# EasyEDA Pro project ProPrj_H750VBT6M2_2025-05-30.epro, board PCB1
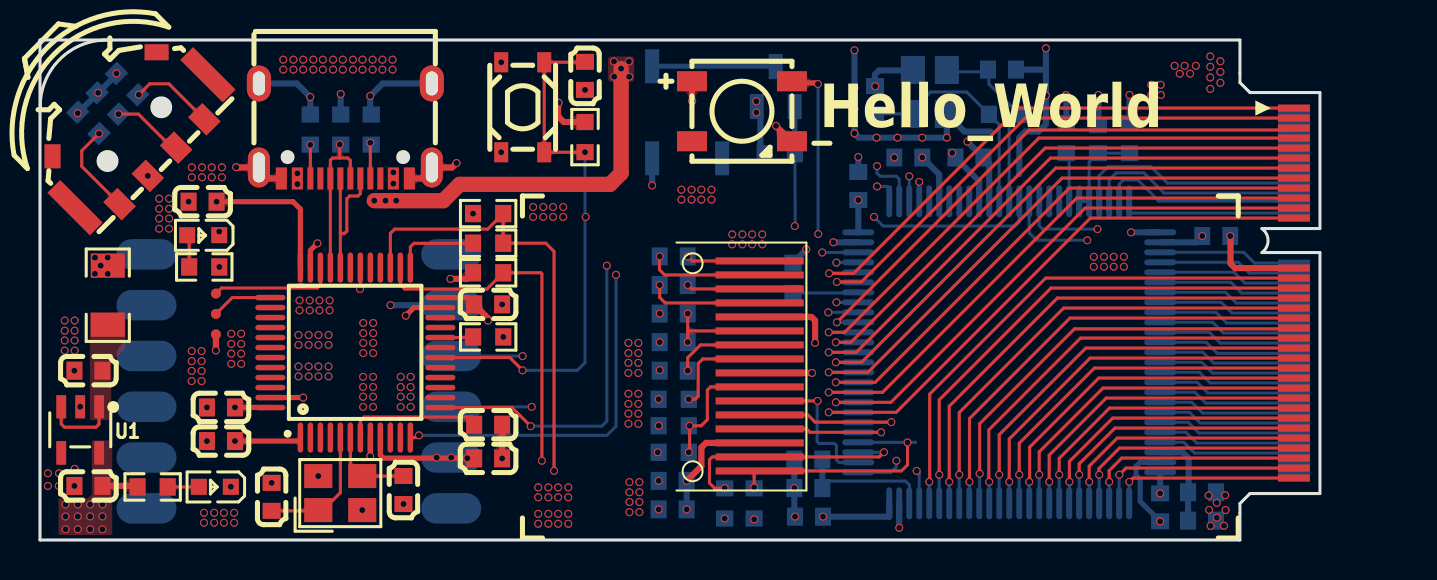
[diagram p2: board, top side]
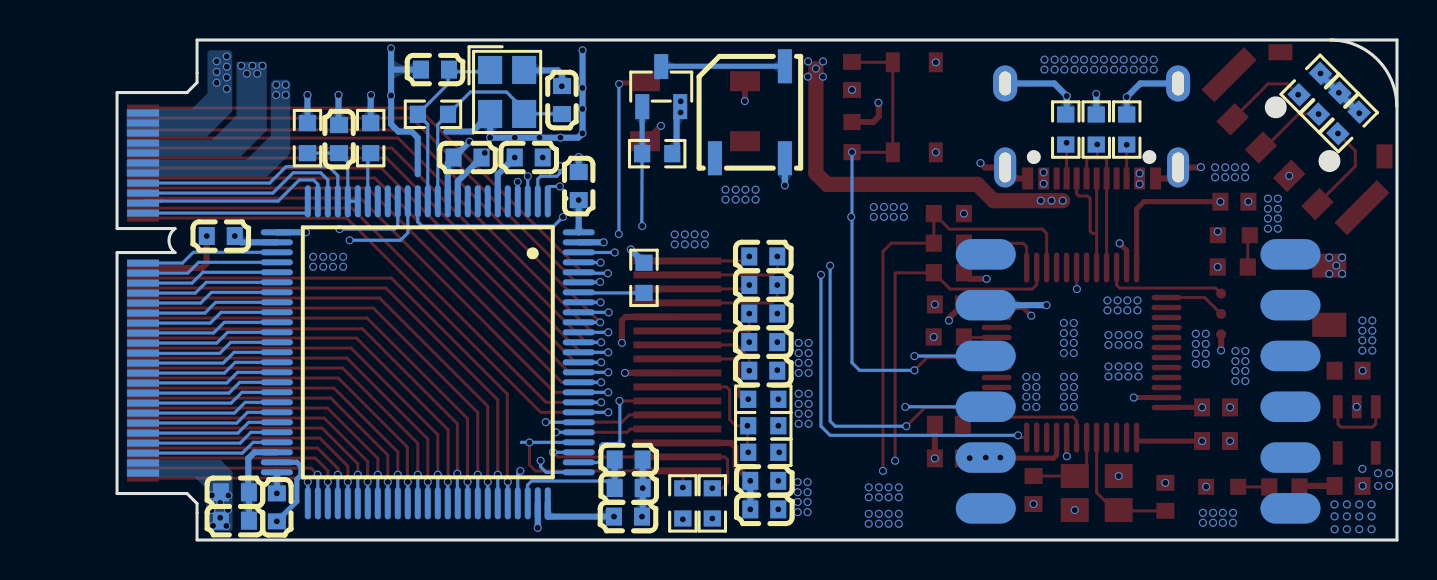
[diagram p3: board, bottom side, seen from below]

Outline 67.87 x 25 mm; copper layers: Top Layer, Inner1, Inner2, Inner3, Inner4, Bottom Layer. Coordinates in mm from the lower left corner of the outline.
Outline path: 0.01,21.68 arc(0.98,24.03) 3.33,25 ; 60.01,23.35 60.01,25 0,25 0,0 60.01,0 60.01,1.35
Stack: Top Layer 0.035mm 外层铜厚1oz / Dielectric1 0.0994mm 3313 RC57% 4.2mil / Inner1 0.0152mm 内层铜厚 / Dielectric2 0.55mm 0.55mm H/H No copper / Inner2 0.0152mm 内层铜厚 / Dielectric3 0.1088mm 2116 RC54% 4.9mil / Inner3 0.0152mm 内层铜厚 / Dielectric4 0.55mm 0.55mm H/H No copper / Inner4 0.0152mm 内层铜厚 / Dielectric5 0.0994mm 3313 RC57% 4.2mil / Bottom Layer 0.035mm 外层铜厚1oz

## Design rules (mm)
net DN: DP1
net DP: DP1
template: 自定义配置
spacing copperThickness1oz (default): track to track 0.152, other pairs 0.15 to 0.152
spacing copperThickness2oz: track to track 0.203, other pairs 0.152 to 0.3
track width copperThickness1oz (default): min 0.127, default 0.152, max 2.54
track width copperThickness2oz: min 0.203, default 0.305, max 2.54
differential pair differentialPair (default): width min 0.127, default 0.254, max 2.54; gap min 0.152, default 0.152
via viaSize (default): diameter min 0.399, default 0.399, max 10; hole min 0.3, default 0.3, max 6.299
net 3V3 uses copperThickness2oz
net GND uses copperThickness2oz
net 5V uses copperThickness2oz

## Placement (name value [footprint] x y rotation side)
BUZZER1  4kHz  [BUZ-SMD_L5.0-W5.5-P4.60]  32.37 21.39 90 bottom
C1  100nF  [C0603]  2.42 8.47 0 top
C2  100nF  [C0603]  2.42 2.7 0 top
C4  100nF  [C0603]  58.83 15.2 180 bottom
C5  100nF  [C0603]  43.43 19.12 0 bottom
C6  100nF  [C0603]  46.49 19.12 0 bottom
C7  100nF  [C0603]  38.46 1.17 0 bottom
C8  100nF  [C0603]  40.93 17.7 270 bottom
C9  100nF  [C0603]  56.02 1.63 90 bottom
C12  12pF  [C0603]  11.59 2.16 90 top
C13  12pF  [C0603]  18.18 2.5 90 top
C14  100nF  [C0603]  9.05 6.63 0 top
C15  100nF  [C0603]  9.05 4.95 0 top
C16  100nF  [C0603]  22.41 4.08 180 top
C17  100nF  [C0603]  22.41 11.78 180 top
C18  100nF  [C0603]  8.13 16.92 0 top
C19  100nF  [C0603]  22.41 5.76 180 top
C21  2.2uF  [C0603]  58.12 2.39 0 bottom
C22  2.2uF  [C0603]  58.12 0.97 0 bottom
C23  2.2uF  [C0603]  38.43 4.02 0 bottom
C24  2.2uF  [C0603]  38.43 2.59 0 bottom
C25  100nF  [C0603]  52.91 20.04 270 bottom
C26  100nF  [C0603]  27.26 23.21 90 top
C27  1uF  [C0603]  31.69 14.18 180 bottom
C28  1uF  [C0603]  31.69 12.75 180 bottom
C29  100nF  [C0603]  31.64 2.96 180 bottom
C30  4.7uF  [C0603]  31.64 1.53 180 bottom
C31  2.2uF  [C0603]  31.69 8.47 180 bottom
C32  100nF  [C0603]  31.69 9.89 180 bottom
C33  4.7uF  [C0603]  31.69 11.32 180 bottom
C34  15pF  [C0603]  41.76 22 90 bottom
C35  15pF  [C0603]  48.11 23.52 180 bottom
CN1  M.2-E Key GF  [NGFF-M.2-75P-0.5mmE KEYGF]  64.01 12.35 270 top
LED1  -  [LED_0603]  8.69 2.65 180 top
LED3  -  [LED_0603]  8.11 15.23 180 top
LED4  XL-5050RGBC-WS2812B  [LED-SMD_4P-L5.0-W5.0-BL_XL-5050RGBC]  35.11 21.44 270 top
Q1  -  [SOT-23-3_L2.9-W1.3-P1.90-LS2.4-BR]  36.8 22.67 270 bottom
R1  1K  [R0603]  5.63 2.65 0 top
R2  1.1A 6V  [R1206]  3.39 12.24 270 top
R6  5.1K  [R0603]  16.57 20.52 90 bottom
R7  5.1K  [R0603]  13.52 20.52 90 bottom
R8  100R  [R0603]  22.41 14.84 0 top
R9  10K  [R0603]  22.41 16.32 180 top
R10  10K  [R0603]  22.41 13.36 180 top
R11  1K  [R0603]  8.22 13.65 180 top
R12  10K  [R0603]  22.42 10.15 180 top
R13  0R  [R0603]  51.33 20.09 270 bottom
R14  0R  [R0603]  54.49 20.09 270 bottom
R15  10K  [R0603]  27.26 20.15 90 top
R16  10K  [R0603]  37.66 13.11 90 bottom
R59  10K  [R0603]  2.42 20.86 135 bottom
R60  10K  [R0603]  4.36 22.8 135 bottom
R61  10K  [R0603]  3.39 21.83 135 bottom
R62  4.7K  [R0603]  31.69 4.39 180 bottom
R63  4.7K  [R0603]  31.69 5.71 0 bottom
R64  390K  [R0603]  31.69 7.04 180 bottom
R65  10K  [R0603]  35.72 1.83 90 bottom
R66  10K  [R0603]  34.24 1.83 90 bottom
R67  1.5K  [R0603]  15.04 20.52 270 bottom
R68  1M  [R0603]  48.21 21.28 180 bottom
R69  10K  [R0603]  37 19.32 180 bottom
SW1  TS3425BA  [SW-SMD_4P-L4.2-W3.2-P2.15-LS4.6-1]  24.14 21.64 270 top
SW2  TM-2024A  [SW-SMD_TM-2024A]  4.66 20.35 45 top
TP1  -  [Test-Point-0.5mm]  8.8 12.32 0 top
TP2  -  [Test-Point-0.5mm]  8.8 11.3 0 top
TP3  -  [Test-Point-0.5mm]  8.8 10.28 0 top
U1  RT9013-33GB  [SOT-23-5_L3.0-W1.7-P0.95-LS2.8-BL]  2.01 5.51 180 top
U2  STM32H750VBT6  [LQFP-100_L14.0-W14.0-P0.50-LS16.0-BL]  48.47 9.38 0 bottom
U4  STM32F103C8T6  [LQFP-48_L7.0-W7.0-P0.50-LS9.0-BL]  15.77 9.37 0 top
U5  -  [JY901S]  5.33 1.58 0 bottom
U6  -  [1.29oled_spi_焊接_ch1115]  58.88 1.07 180 top
USB1  TYPE-C 16PIN 2MD(073)  [USB-C-SMD_TYPE-C-6PIN-2MD-073]  15.27 20.45 180 top
X2  8MHz  [CRYSTAL-SMD_4P-L3.2-W2.5-BL]  15.02 2.35 0 top
X3  25MHz  [CRYSTAL-SMD_4P-L3.2-W2.5-BL]  44.51 22.4 270 bottom

## Footprints (pads in the part's own frame, mm; a bottom-side part is the same pattern mirrored in y, then rotated)
1.29oled_spi_焊接_ch1115
  rect 4.4x0.35 smd: 1(22.884,-12.883) 2(22.884,-12.183) 3(22.884,-11.483) 4(22.884,-10.783) 5(22.884,-10.083) 6(22.884,-9.383) 7(22.884,-8.683) 8(22.884,-7.983) 9(22.884,-7.283) 10(22.884,-6.583) 11(22.884,-5.883) 12(22.884,-5.183) 13(22.884,-4.483) 14(22.884,-3.783) 15(22.884,-3.083) 16(22.884,-2.383)
BUZ-SMD_L5.0-W5.5-P4.60
  rect 1.7x0.7 smd: 1(-2.3,-1.75) 2(2.3,-1.75) 3(-2.3,1.75)
C0603
  rect 0.8x0.9 smd: 1(-0.7,0) 2(0.7,0)
CRYSTAL-SMD_4P-L3.2-W2.5-BL
  rect 1.4x1.2 smd: 1(-1.1,-0.85) 2(1.1,-0.85) 3(1.1,0.85) 4(-1.1,0.85)
JY901S
  oval 3x1.524 smd: 1(0,0) 2(0,-2.54) 3(0,-5.08) 4(0,-7.62) 5(0,-10.16) 6(0,-12.7) 7(15.24,-12.7) 8(15.24,-10.16) 9(15.24,-7.62) 10(15.24,-5.08) 11(15.24,-2.54) 12(15.24,0)
LED-SMD_4P-L5.0-W5.0-BL_XL-5050RGBC
  rect 1x1.5 smd: 1(-1.5,-2.5) 2(1.5,-2.5) 3(1.5,2.5) 4(-1.5,2.5)
LED_0603
  rect 0.8x0.8 smd: 1(-0.851,-0.01) 2(0.75,-0.005)
LQFP-48_L7.0-W7.0-P0.50-LS9.0-BL
  oval 0.27x1.5 smd: 1(-2.75,-4.25) 2(-2.25,-4.25) 3(-1.75,-4.25) 4(-1.25,-4.25) 5(-0.75,-4.25) 6(-0.25,-4.25) 7(0.25,-4.25) 8(0.75,-4.25) 9(1.25,-4.25) 10(1.75,-4.25) 11(2.25,-4.25) 12(2.75,-4.25) 25(2.75,4.25) 26(2.25,4.25) 27(1.75,4.25) 28(1.25,4.25) 29(0.75,4.25) 30(0.25,4.25) 31(-0.25,4.25) 32(-0.75,4.25) 33(-1.25,4.25) 34(-1.75,4.25) 35(-2.25,4.25) 36(-2.75,4.25)
  oval 1.5x0.27 smd: 13(4.25,-2.75) 14(4.25,-2.25) 15(4.25,-1.75) 16(4.25,-1.25) 17(4.25,-0.75) 18(4.25,-0.25) 19(4.25,0.25) 20(4.25,0.75) 21(4.25,1.25) 22(4.25,1.75) 23(4.25,2.25) 24(4.25,2.75) 37(-4.25,2.75) 38(-4.25,2.25) 39(-4.25,1.75) 40(-4.25,1.25) 41(-4.25,0.75) 42(-4.25,0.25) 43(-4.25,-0.25) 44(-4.25,-0.75) 45(-4.25,-1.25) 46(-4.25,-1.75) 47(-4.25,-2.25) 48(-4.25,-2.75)
LQFP-100_L14.0-W14.0-P0.50-LS16.0-BL
  oval 0.3x1.6 smd: 1(-6,-7.55) 2(-5.5,-7.55) 3(-5,-7.55) 4(-4.5,-7.55) 5(-4,-7.55) 6(-3.5,-7.55) 7(-3,-7.55) 8(-2.5,-7.55) 9(-2,-7.55) 10(-1.5,-7.55) 11(-1,-7.55) 12(-0.5,-7.55) 13(0,-7.55) 14(0.5,-7.55) 15(1,-7.55) 16(1.5,-7.55) 17(2,-7.55) 18(2.5,-7.55) 19(3,-7.55) 20(3.5,-7.55) 21(4,-7.55) 22(4.5,-7.55) 23(5,-7.55) 24(5.5,-7.55) 25(6,-7.55) 51(6,7.55) 52(5.5,7.55) 53(5,7.55) 54(4.5,7.55) 55(4,7.55) 56(3.5,7.55) 57(3,7.55) 58(2.5,7.55) 59(2,7.55) 60(1.5,7.55) 61(1,7.55) 62(0.5,7.55) 63(0,7.55) 64(-0.5,7.55) 65(-1,7.55) 66(-1.5,7.55) 67(-2,7.55) 68(-2.5,7.55) 69(-3,7.55) 70(-3.5,7.55) 71(-4,7.55) 72(-4.5,7.55) 73(-5,7.55) 74(-5.5,7.55) 75(-6,7.55)
  oval 1.6x0.3 smd: 26(7.55,-6) 27(7.55,-5.5) 28(7.55,-5) 29(7.55,-4.5) 30(7.55,-4) 31(7.55,-3.5) 32(7.55,-3) 33(7.55,-2.5) 34(7.55,-2) 35(7.55,-1.5) 36(7.55,-1) 37(7.55,-0.5) 38(7.55,0) 39(7.55,0.5) 40(7.55,1) 41(7.55,1.5) 42(7.55,2) 43(7.55,2.5) 44(7.55,3) 45(7.55,3.5) 46(7.55,4) 47(7.55,4.5) 48(7.55,5) 49(7.55,5.5) 50(7.55,6) 76(-7.55,6) 77(-7.55,5.5) 78(-7.55,5) 79(-7.55,4.5) 80(-7.55,4) 81(-7.55,3.5) 82(-7.55,3) 83(-7.55,2.5) 84(-7.55,2) 85(-7.55,1.5) 86(-7.55,1) 87(-7.55,0.5) 88(-7.55,0) 89(-7.55,-0.5) 90(-7.55,-1) 91(-7.55,-1.5) 92(-7.55,-2) 93(-7.55,-2.5) 94(-7.55,-3) 95(-7.55,-3.5) 96(-7.55,-4) 97(-7.55,-4.5) 98(-7.55,-5) 99(-7.55,-5.5) 100(-7.55,-6)
NGFF-M.2-75P-0.5mmE KEYGF
  rect 0.35x1.6 smd: 1(-9.25,-1.3) 3(-8.75,-1.3) 5(-8.25,-1.3) 7(-7.75,-1.3) 9(-7.25,-1.3) 11(-6.75,-1.3) 13(-6.25,-1.3) 15(-5.75,-1.3) 17(-5.25,-1.3) 19(-4.75,-1.3) 21(-4.25,-1.3) 23(-3.75,-1.3) 33(-1.25,-1.3) 35(-0.75,-1.3) 37(-0.25,-1.3) 39(0.25,-1.3) 41(0.75,-1.3) 43(1.25,-1.3) 45(1.75,-1.3) 47(2.25,-1.3) 49(2.75,-1.3) 51(3.25,-1.3) 53(3.75,-1.3) 55(4.25,-1.3) 57(4.75,-1.3) 59(5.25,-1.3) 61(5.75,-1.3) 63(6.25,-1.3) 65(6.75,-1.3) 67(7.25,-1.3) 69(7.75,-1.3) 71(8.25,-1.3) 73(8.75,-1.3) 75(9.25,-1.3)
  rect 0.35x1.6 smd far side: 2(-9,-1.3) 4(-8.5,-1.3) 6(-8,-1.3) 8(-7.5,-1.3) 10(-7,-1.3) 12(-6.5,-1.3) 14(-6,-1.3) 16(-5.5,-1.3) 18(-5,-1.3) 20(-4.5,-1.3) 22(-4,-1.3) 32(-1.5,-1.3) 34(-1,-1.3) 36(-0.5,-1.3) 38(0,-1.3) 40(0.5,-1.3) 42(1,-1.3) 44(1.5,-1.3) 46(2,-1.3) 48(2.5,-1.3) 50(3,-1.3) 52(3.5,-1.3) 54(4,-1.3) 56(4.5,-1.3) 58(5,-1.3) 60(5.5,-1.3) 62(6,-1.3) 64(6.5,-1.3) 66(7,-1.3) 68(7.5,-1.3) 70(8,-1.3) 72(8.5,-1.3) 74(9,-1.3)
R0603
  rect 0.806x0.864 smd: 1(-0.753,0) 2(0.753,0)
R1206
  rect 1.208x1.701 smd: 1(-1.479,0) 2(1.479,0)
SOT-23-3_L2.9-W1.3-P1.90-LS2.4-BR
  rect 1.25x0.7 smd: 1(1,-0.95) 2(1,0.95) 3(-1,0)
SOT-23-5_L3.0-W1.7-P0.95-LS2.8-BL
  rect 0.49x1.157 smd: 1(-0.95,-1.153) 2(0,-1.153) 3(0.95,-1.153)
  rect 0.49x1.175 smd: 4(0.95,1.153) 5(-0.95,1.153)
SW-SMD_4P-L4.2-W3.2-P2.15-LS4.6-1
  rect 1x0.7 smd: 1(-2.25,1.075) 2(2.25,1.075) 3(-2.25,-1.075) 4(2.25,-1.075)
SW-SMD_TM-2024A
  rect 1x1.3 smd: 1(-3,-2.03) 2(3,-2.03) 3(-1,-2.03) 4(1,-2.03)
  rect 0.9x3 smd: 5(-4.7,-0.58) 6(4.7,-0.58)
  rect 1.2x0.8 smd rot 45: 7(-3.68,2.03)
  rect 1.2x0.8 smd rot 135: 8(3.68,2.03)
Test-Point-0.5mm
  round 0.5 smd: 1(0,0)
USB-C-SMD_TYPE-C-6PIN-2MD-073
  rect 0.55x1.1 smd: 1(-3.2,2.375) 2(-2.4,2.375) 11(2.4,2.375) 12(3.2,2.375)
  rect 0.3x1.1 smd: 3(-1.75,2.375) 4(-1.25,2.375) 5(-0.75,2.375) 6(-0.25,2.375) 7(0.25,2.375) 8(0.75,2.375) 9(1.25,2.375) 10(1.75,2.375)
  oval 1.1x2 hole 0.6x1.5: 13(-4.325,1.825) 14(4.325,1.825)
  oval 1.2x1.8 hole 0.6x1.2: 13(-4.325,-2.375) 14(4.325,-2.375)

## Nets
As in the schematic.

Pads without a net: BUZZER1 3; LED4 2; SW2 5 6 7 8; U1 4; U4 2 3 4 10 11 14 15 16 17 19 21 22 28 29 31 38 39 40 41 42 43 44 45 46; U5 1 2 3 4 5 6 7 12; USB1 3 9

## Via types
v1: diameter 0.399, hole 0.299, Top Layer to Bottom Layer, 229 vias
v2: diameter 0.4, hole 0.3, Top Layer to Bottom Layer, 199 vias

## Routing (per net, layer and track width the routed paths; a pad name or vN(x,y) marks a point on that pad's centre or on a via; arc(x,y) is an arc through that point)
3V3: length 59.1
  Top Layer w0.254: U4.48 11.52,6.63 v2(9.75,6.63) ; v2(9.75,4.95) 13.02,4.95 U4.1 ; U4.24 21.37,12.12 C17.2 ; U4.9 17.02,4.25 17.18,4.09 v2(21.37,4.09) 21.6,4.09 21.71,3.98 21.71,3.98 ; U4.36 13.02,16.55 12.65,16.92 v2(8.83,16.92)
  Top Layer w0.305: v1(32.62,21.95) 32.61,21.96 LED4.1 ; R10.2 21.35,13.06 v2(20.53,13.06) ; v2(25.94,21.86) 25.91,21.84 25.91,21.18 26.2,20.9 27.26,20.9 ; v2(38.77,9.86) 38.77,10.97 38.58,11.15 U6.5 ; C2.2 4.83,2.7 R1.1 ; U6.14 33.31,4.85 33.08,4.62 33.08,3.69 v2(32.34,2.96) ; C17.2 22.41,11.09 v2(22.41,10.97)
  Bottom Layer w0.305: U2.50 56.02,2.33 v2(56.02,2.33) ; BUZZER1.1 v1(30.62,17.73) ; v2(44.13,19.12) 44.97,18.28 U2.6 ; U2.75 42.47,1.17 v2(39.16,1.17) ; v2(1.89,21.34) v2(2.91,22.36) ; v2(2.91,22.36) 3.83,23.28 v2(3.83,23.33) ; v2(2.91,22.36) 2.91,22.41 ; U2.11 47.47,18.84 C6.2 47.17,19.12 v2(46.39,19.91) ; 14.99,21.33 15.04,21.38 v1(15.04,22.3) ; R14.1 v2(54.49,22.25) ; U2.100 40.93,15.39 v2(40.93,17) ; v2(32.34,1.53) v2(32.34,2.96) ; v2(58.13,15.2) 57.81,14.88 U2.27
  vias: v2(1.28,1.78) v2(1.28,1.18) v2(1.28,0.54) v2(1.89,1.78) v2(1.89,1.18) v2(1.89,0.54) v2(2.5,1.78) v2(2.51,1.18) v2(2.51,0.54) v2(3.13,1.78) v2(3.12,1.18) v2(3.12,0.53) v2(19.84,4.12) v2(20.57,4.12) v2(21.66,16.32) v2(30.9,4.39) v2(55.58,22.76) v2(55.58,22.25) v2(56.05,22.76) v2(56.06,22.25)
5V: length 46.8
  Top Layer w0.762: v2(16.72,16.97) v2(17.28,16.97) v2(17.82,16.97) 20.17,16.97 20.99,17.78 28.5,17.78 29.06,18.34 v1(29.06,23.57)
  Inner3 w0.762: v1(29.06,23.57) 57.66,23.57 57.71,23.52
  vias: v1(28.71,23.93) v1(28.71,23.17) v1(29.46,23.93) v1(29.47,23.17) v2(2.75,14.12) v2(2.75,13.31) v2(3.03,13.72) v2(3.39,14.12) v2(3.39,13.31) v2(12.87,18.33) v2(12.87,17.79) v2(17.67,18.38) v2(17.67,17.82) v2(56.74,23.71) v2(57,23.32) v2(57.25,23.71) v2(57.52,23.32) v2(57.81,23.71)
GND: length 77.9
  Top Layer w0.254: v2(16.51,4.19) 16.52,4.2 16.52,5.2 ; v2(13.87,14.83) 13.52,14.48 U4.35 ; v2(18.29,11.22) 18.7,11.62 U4.23 ; U4.47 v2(13.16,7.12)
  Top Layer w0.305: v2(20.83,18.85) 20.61,18.63 USB1.13 19.05,18.08 USB1.1 ; USB1.12 11.5,18.08 USB1.14 9.83,18.63 v2(9.81,18.64) ; v2(59.53,15.2) 59.54,15.18 59.54,13.82 59.76,13.6 CN1.33 ; 37.61,19.9 36.81,20.7 v1(36.81,20.71) ; U6.9 v2(38.61,8.35) ; C19.1 v2(23.11,4.08) ; TP3.1 v2(8.8,9.48)
  Bottom Layer w0.254: v2(56.02,0.93) 55.02,1.93 55.02,3.04 54.82,3.24 54.82,3.69 55.02,3.88 U2.49
  Bottom Layer w0.305: v2(51.31,22.25) 51.33,22.23 R13.1 ; USB1.13 17.14,22.83 v2(16.51,22.2) 16.51,21.33 ; 41.78,22.62 41.76,22.64 41.76,23.27 41.97,23.48 43.71,23.48 ; 47.55,20.42 46.24,20.42 45.36,21.3 v1(45.36,20.12) v1(44.12,20.12) v1(42.89,20.12) v1(41.84,20.12) 40.95,20.12 v1(40.73,20.33) v1(40.73,21.55) v1(40.73,22.6) v1(40.73,24.49) ; v2(37.76,1.17) 37.73,1.2 v2(37.73,2.59) C23.1 ; R69.2 36.03,19.53 36.03,21.18 v1(35.83,21.38) ; C35.1 50.31,23.52 ; 50.31,23.52 v1(50.31,22.22) 50.31,20.79 49.94,20.42 49.28,20.42 48.98,20.12 48.98,18.29 ; 50.31,23.52 v1(50.31,24.59) ; C25.1 52.94,20.77 v2(52.94,22.25) ; v2(38.32,14.53) 38.32,14.52 R16.2 ; U2.74 v2(42.97,0.61) ; USB1.14 12.84,22.83 v2(13.52,22.15) R7.2 ; U5.8 v2(17.53,11.74) ; U2.99 v2(39.68,14.88) ; C6.1 46.97,17.94 U2.10 ; 40.93,18.4 v2(40.93,19.15) ; U2.26 v2(54.56,15.38)
  vias: v1(1.24,10.97) v1(1.24,10.47) v1(1.24,9.98) v1(1.24,9.47) v1(1.73,10.97) v1(1.73,10.47) v1(1.73,9.98) v1(1.73,9.47) v1(5.96,17.07) v1(5.96,16.56) v1(5.96,16.07) v1(5.96,15.57) v1(6.46,17.07) v1(6.46,16.56) v1(6.46,16.07) v1(6.46,15.57) v1(7.59,18.63) v1(7.59,18.14) v1(7.59,9.45) v1(7.59,8.94) v1(7.59,8.45) v1(7.59,7.95) v1(8.1,18.63) v1(8.1,18.14) v1(8.08,9.45) v1(8.08,8.94) v1(8.08,8.45) v1(8.08,7.95) v1(8.2,1.36) v1(8.2,0.86) v1(8.59,18.63) v1(8.59,18.14) v1(8.71,1.36) v1(8.71,0.86) v1(9.1,18.63) v1(9.1,18.14) v1(9.2,1.36) v1(9.2,0.86) v1(9.57,10.31) v1(9.57,9.8) v1(9.57,9.32) v1(9.57,8.81) v1(9.71,1.36) v1(9.71,0.86) v1(10.06,10.31) v1(10.06,9.8) v1(10.06,9.32) v1(10.06,8.81) v1(12.17,24.02) v1(12.17,23.52) v1(12.68,24.02) v1(12.67,23.52) v1(12.93,10.25) v1(12.93,9.75) v1(12.93,8.68) v1(12.93,8.18) v1(12.98,11.98) v1(12.98,11.48) v1(13.16,24.02) v1(13.16,23.52) v1(13.44,10.25) v1(13.44,9.75) v1(13.44,8.68) v1(13.44,8.18) v1(13.49,11.98) v1(13.49,11.48) v1(13.67,24.02) v1(13.67,23.52) v1(13.92,10.25) v1(13.92,9.75) v1(13.92,8.68) v1(13.92,8.18) v1(13.98,11.98) v1(13.98,11.48) v1(14.15,24.02) v1(14.15,23.52) v1(14.43,10.25) v1(14.43,9.75) v1(14.43,8.68) v1(14.43,8.18) v1(14.48,11.98) v1(14.48,11.48) v1(14.66,24.02) v1(14.66,23.52) v1(15.14,24.02) v1(15.14,23.52) v1(15.65,24.02) v1(15.65,23.52) v1(16.13,24.02) v1(16.13,23.52) v1(16.17,10.85) v1(16.17,10.34) v1(16.17,9.85) v1(16.17,9.35) v1(16.16,8.16) v1(16.16,7.65) v1(16.16,7.16) v1(16.16,6.66) v1(16.64,24.02) v1(16.64,23.52) v1(16.66,10.85) v1(16.66,10.34) v1(16.66,9.85) v1(16.66,9.35) v1(16.66,8.16) v1(16.66,7.65) v1(16.66,7.16) v1(16.66,6.65) v1(17.12,24.02) v1(17.12,23.52) v1(17.63,24.02) v1(17.63,23.52) v1(18.04,8.16) v1(18.04,7.65) v1(18.04,7.16) v1(18.04,6.66) v1(18.54,8.16) v1(18.54,7.65) v1(18.54,7.16) v1(18.54,6.65) v1(24.66,16.65) v1(24.66,16.15) v1(24.92,2.63) v1(24.92,2.13) v1(24.92,1.31) v1(24.92,0.81) v1(25.17,16.65) v1(25.17,16.15) v1(25.43,2.63) v1(25.43,2.13) v1(25.43,1.31) v1(25.43,0.81) v1(25.66,16.65) v1(25.66,16.15) v1(25.91,2.63) v1(25.91,2.13) v1(25.91,1.31) v1(25.91,0.81) v1(26.17,16.65) v1(26.17,16.15) v1(26.42,2.63) v1(26.42,2.13) v1(26.42,1.31) v1(26.42,0.81) v1(29.43,9.86) v1(29.43,9.35) v1(29.43,8.86) v1(29.43,8.35) v1(29.43,7.32) v1(29.43,6.81) v1(29.43,6.32) v1(29.43,5.81) v1(29.48,2.9) v1(29.48,2.39) v1(29.48,1.9) v1(29.48,1.39) v1(29.93,9.86) v1(29.93,9.35) v1(29.93,8.86) v1(29.93,8.35) v1(29.93,7.31) v1(29.93,6.81) v1(29.93,6.32) v1(29.93,5.81) v1(29.98,2.9) v1(29.98,2.39) v1(29.98,1.9) v1(29.98,1.39) v1(32.08,17.51) v1(32.08,17.02) v1(32.59,17.51) v1(32.59,17.02) v1(33.08,17.51) v1(33.08,17.02) v1(33.58,17.51) v1(33.58,17.02) v1(34.62,15.28) v1(34.62,14.78) v1(35.13,15.28) v1(35.13,14.78) v1(35.62,15.28) v1(35.62,14.78) v1(35.83,21.93) v1(36.12,15.28) v1(36.12,14.78) v1(41.77,22.69) v1(52.71,14.16) v1(52.71,13.67) v1(53.21,14.16) v1(53.21,13.67) v1(53.7,14.16) v1(53.7,13.67) v1(54.21,14.16) v1(54.21,13.67) v1(58.44,2.23) v1(58.47,1.51) v1(58.54,0.7) v1(58.85,1.86) v1(58.86,1.11) v1(59.22,0.71) v1(59.28,2.24) v1(59.29,1.5) v2(0.4,3.34) v2(0.4,2.7) v2(0.94,2.7) v2(0.95,3.34) v2(1.72,8.47) v2(1.73,3.56) v2(1.72,2.7) v2(2.01,6.66) v2(5.39,18.21) v2(7.43,16.92) v2(8.35,6.63) v2(8.35,4.95) v2(8.96,15.42) v2(9.54,2.66) v2(11.59,2.86) v2(13.92,3.2) v2(16.12,1.5) v2(18.18,1.8) v2(23.07,23.89) v2(23.07,19.39) v2(23.11,11.78) v2(23.17,10.15) v2(27.26,22.51) v2(30.94,7.04) v2(30.94,5.71) v2(30.94,2.96) v2(30.94,1.53) v2(30.99,11.32) v2(30.99,9.89) v2(30.99,8.49) v2(34.24,1.08) v2(35.72,1.03) v2(42.73,19.12) v2(45.62,19.36) v2(58.53,24.18) v2(58.53,23.66) v2(58.53,23.13) v2(58.53,22.56) v2(59.03,23.94) v2(59.03,23.41) v2(59.03,22.86)
BOOT0: length 3.3
  Bottom Layer w0.152: R16.1 40.89,12.35 U2.94
BUZZER: length 25.4
  Inner3 w0.152: v1(37.75,15.7) 37.78,15.73 52.71,15.73 v1(52.89,15.55)
  Bottom Layer w0.152: v1(52.89,15.55) 50.15,15.55 49.97,15.72 U2.16 ; 37.75,19.33 37.77,15.73 37.75,15.71
  Bottom Layer w0.254: 37.75,19.33 37.75,21.66 Q1.1
CCW: length 47.2
  Top Layer w0.152: SW2.1 2.09,18.68 2.09,19.46 v2(2.95,20.33)
  Inner3 w0.152: v2(41.86,17.68) 35.41,17.68 34.7,18.39 34.7,20.31 34.59,20.42 3.05,20.42 v2(2.95,20.33)
  Bottom Layer w0.152: v2(41.86,17.68) 42.37,17.68 42.47,17.58 U2.1
CW: length 46.5
  Top Layer w0.152: 8.22,21.03 6.45,22.81 5.49,22.81 v2(4.94,22.26)
  Inner3 w0.152: v2(41.86,18.69) 36.07,18.69 35.72,19.05 35.72,20.78 35.26,21.23 7.83,21.23 6.56,22.5 5.18,22.5 v2(4.94,22.26)
  Bottom Layer w0.152: v2(41.86,18.69) 41.86,18.34 42.02,18.19 42.83,18.19 42.97,18.04 U2.2
DAP_NRST: length 49.8
  Top Layer w0.152: C26.2 27.24,23.89 SW1.1 SW1.2 27.25,19.39 v2(27.26,19.39) ; v2(24.13,8.48) 23.5,9.12 U4.18
  Inner3 w0.152: v2(41.71,16.15) v2(27.29,16.15)
  Bottom Layer w0.152: v2(27.26,19.39) 27.26,8.86 26.88,8.48 v2(24.13,8.48) ; v2(41.71,16.15) 42.17,15.7 48.77,15.7 48.97,15.9 U2.14
DAP_RX: length 29.4
  Top Layer w0.152: U4.13 23.61,6.62 v2(24.54,5.69)
  Inner3 w0.152: v2(28.35,13.72) 38.46,13.72 v2(39.12,14.38)
  Bottom Layer w0.152: v2(28.35,13.72) 28.35,5.94 28.1,5.69 v2(24.54,5.69) ; v2(39.12,14.38) 40.92,14.38 U2.98
DAP_TX: length 30.5
  Top Layer w0.152: v2(18.95,5.23) 18.84,5.12 U4.12
  Inner3 w0.152: v2(28.81,13.26) 38.61,13.26 39.22,13.87 v2(39.83,13.87)
  Bottom Layer w0.152: v2(39.83,13.87) 40.91,13.87 U2.97 ; v2(28.81,13.26) 28.81,5.69 28.35,5.23 v2(18.95,5.23)
DN: length 8
  Top Layer w0.152: USB1.7 15.02,15.32 ; 15.02,15.32 15.02,13.62 ; 15.02,15.32 15.23,15.32 15.35,15.44 15.35,17.07 15.48,17.2 15.91,17.2 16.02,17.32 USB1.5
DP: length 8
  Top Layer w0.152: 14.99,19.1 14.64,19.1 14.52,18.99 USB1.8 14.52,13.62 ; 14.99,19.1 14.99,19.78 v1(14.99,19.78) ; 14.99,19.1 15.4,19.1 15.52,18.98 USB1.6
MPU_SCL: length 24.3
  Inner3 w0.152: v2(24.59,6.66) 24.59,10.06 24.9,10.36 38.41,10.36 v2(39.43,11.38)
  Bottom Layer w0.152: U5.10 24.59,6.66 v2(24.59,6.66) ; v2(39.43,11.38) 39.43,11.38 U2.92
MPU_SDA: length 22.1
  Inner3 w0.152: v2(24.13,9.19) 24.13,10.26 24.64,10.77 38.05,10.77 39.17,11.88 v2(39.83,11.88)
  Bottom Layer w0.152: v2(24.13,9.19) 24.13,9.2 20.57,9.2 ; U2.93 v2(39.83,11.88)
OLED_A0: length 8.4
  Top Layer w0.152: U6.12 38.4,6.25 38.77,5.89 v2(42.58,5.89)
  Bottom Layer w0.152: U2.81 42.57,5.88 v2(42.58,5.89)
OLED_CS: length 7.8
  Top Layer w0.152: U6.11 v2(38.89,6.95)
  Bottom Layer w0.152: U2.77 40.91,3.87 39.97,3.87 39.83,4.01 39.83,4.72 39.73,4.83 38.97,4.83 38.87,4.93 38.87,6.86 38.89,6.88 v2(38.89,6.95)
OLED_RES: length 7.3
  Top Layer w0.152: v2(42.07,5.39) 38.51,5.39 38.34,5.55 U6.13
  Bottom Layer w0.152: U2.80 v2(42.07,5.38)
OLED_SCL: length 12.2
  Top Layer w0.152: v2(42.21,4.39) 41.97,4.15 U6.15 33.62,4.15 33.48,4.01 33.48,2.84 33.74,2.59 v2(34.24,2.59)
  Bottom Layer w0.152: v2(34.24,2.59) R66.2 ; v2(42.21,4.39) 42.2,4.38 U2.78
OLED_SI: length 12.6
  Top Layer w0.152: v2(43.39,4.88) 43.39,3.76 43.08,3.45 U6.16 35.72,3.45 v2(35.72,2.62)
  Bottom Layer w0.152: U2.79 43.79,4.88 43.79,4.88
PA0: length 11.5
  Bottom Layer w0.152: U2.22 52.97,18.22 53.42,18.67 55.56,18.67 56.38,17.85 CN1.16
PA1: length 10.9
  Bottom Layer w0.152: CN1.18 56.22,17.35 55.21,18.36 53.83,18.36 53.47,18 U2.23
PA2: length 10.2
  Bottom Layer w0.152: CN1.20 62.62,16.94 61.82,16.94 61.81,16.95 55.96,16.95 54.9,18 54.19,18 53.97,17.79 U2.24
PA3: length 8.8
  Bottom Layer w0.152: CN1.22 54.47,16.35 U2.25
PA4: length 6.9
  Bottom Layer w0.152: CN1.32 60.74,13.85 60.2,14.39 U2.28
PA5: length 6.9
  Bottom Layer w0.152: CN1.34 60.48,13.35 59.94,13.89 U2.29
PA6: length 6.9
  Bottom Layer w0.152: U2.30 59.72,13.39 60.26,12.85 CN1.36
PA7: length 6.9
  Bottom Layer w0.152: CN1.38 60.1,12.35 59.56,12.89 U2.31
PA8: length 22.5
  Top Layer w0.152: v2(46.49,2.91) 46.49,6.07 51.51,11.1 CN1.43
  Bottom Layer w0.152: v2(46.49,2.91) 46.49,1.85 46.47,1.83
PA9: length 23.4
  Top Layer w0.152: CN1.41 51.2,11.6 45.97,6.38 v2(45.97,3.26)
  Bottom Layer w0.152: 45.97,1.84 v2(45.97,3.26)
PA10: length 24.3
  Top Layer w0.152: v2(45.47,2.91) 45.47,6.69 50.88,12.1 CN1.39
  Bottom Layer w0.152: 45.47,1.83 v2(45.47,2.91)
PA11: length 25.2
  Top Layer w0.152: v2(44.97,3.26) 44.97,7.01 50.56,12.6 CN1.37
  Bottom Layer w0.152: 44.97,1.83 v2(44.97,3.26)
PA12: length 26.1
  Top Layer w0.152: v2(44.47,2.91) 44.5,2.93 44.5,7.29 50.3,13.1 CN1.35
  Bottom Layer w0.152: 44.47,1.83 v2(44.47,2.91)
PA13: length 42.7
  Top Layer w0.152: v2(25.71,3.45) 25.71,14.43 25.3,14.84 R8.2 R9.1 22.39,15.55 17.73,15.55 17.52,15.33 U4.27
  Inner3 w0.152: v2(43.85,3.45) v2(25.71,3.45)
  Bottom Layer w0.152: v2(43.85,3.45) 43.97,3.33 U2.72
PA14: length 37.8
  Top Layer w0.152: v2(25.1,3.96) 25.1,13.31 25.05,13.36 R10.1 22.35,12.55 18.24,12.55 18.02,12.77 U4.26
  Inner3 w0.152: v2(42.83,3.96) 32.63,3.96 32.63,3.96 30.72,3.96 30.72,3.96 v2(25.1,3.96)
  Bottom Layer w0.152: U2.76 42.56,3.38 42.83,3.66 v2(42.83,3.96)
PB0: length 6.9
  Bottom Layer w0.152: CN1.44 59.35,10.85 58.81,11.39 U2.34
PB1: length 6.9
  Bottom Layer w0.152: U2.35 58.65,10.89 59.18,10.35 62.71,10.35 CN1.46
PB2: length 6.9
  Bottom Layer w0.152: U2.36 58.49,10.39 59.03,9.85 CN1.48
PB3: length 28.1
  Top Layer w0.152: CN1.9 50.27,19.6 40.56,9.88 v2(39.8,9.88)
  Bottom Layer w0.152: U2.89 v2(39.8,9.88)
PB4: length 28.8
  Top Layer w0.152: v2(39.45,10.38) 40.24,10.38 49.95,20.1 CN1.7
  Bottom Layer w0.152: U2.90 v2(39.45,10.38)
PB5: length 28
  Top Layer w0.152: CN1.5 62.62,20.5 49.47,20.5 v2(39.85,10.88)
  Bottom Layer w0.152: U2.91 v2(39.85,10.88)
PB8: length 27.3
  Top Layer w0.152: CN1.3 49.27,21.1 41.08,12.9 v2(39.85,12.9)
  Bottom Layer w0.152: v2(39.85,12.9) 39.87,12.88 U2.95
PB9: length 28.1
  Top Layer w0.152: v2(39.47,13.33) 40.69,13.33 48.96,21.6 CN1.1
  Bottom Layer w0.152: U2.96 40.88,13.34 39.47,13.34
PB10: length 6.9
  Bottom Layer w0.152: 55.82,5.39 57.32,5.39 57.86,4.84 62.51,4.84
PB11: length 6.9
  Bottom Layer w0.152: 55.92,4.89 57.21,4.89 57.75,4.35 62.61,4.35
PB12: length 9.4
  Top Layer w0.152: v2(54.48,2.91) 54.66,3.1 CN1.75
  Bottom Layer w0.152: v2(54.48,2.91) 54.47,2.9 54.47,1.83
PB13: length 10.3
  Top Layer w0.152: v2(53.98,3.26) 54.31,3.6 CN1.73
  Bottom Layer w0.152: v2(53.98,3.26) 53.97,3.26 53.97,1.83
PB14: length 11.1
  Top Layer w0.152: v2(53.47,2.91) 53.47,2.91 53.47,3.47 54.1,4.1 CN1.71
  Bottom Layer w0.152: 53.47,1.83 v2(53.47,2.91)
PB15: length 11.9
  Top Layer w0.152: v2(52.97,3.26) 52.96,3.28 52.96,3.57 53.99,4.6 CN1.69
  Bottom Layer w0.152: 52.97,1.83 v2(52.97,3.26)
PC0: length 27
  Top Layer w0.254: 37.59,22.86 38.85,22.86 v1(38.9,22.8)
  Inner3 w0.152: v1(52.38,14.99) 52.05,15.31 38.94,15.31 v1(38.92,15.3)
  Bottom Layer w0.152: U2.15 49.47,15.35 49.84,14.99 v1(52.38,14.99) ; 38.92,22.75 38.92,15.3 v1(38.92,15.3)
PC4: length 6.9
  Bottom Layer w0.152: U2.32 59.29,12.39 59.83,11.85 CN1.40
PC5: length 6.9
  Bottom Layer w0.152: CN1.42 59.62,11.35 59.08,11.89 U2.33
PC6: length 19.1
  Top Layer w0.152: CN1.51 52.52,9.1 48.47,5.05 v2(48.47,2.91)
  Bottom Layer w0.152: 48.47,1.83 v2(48.47,2.91)
PC7: length 20
  Top Layer w0.152: CN1.49 52.31,9.6 47.97,5.26 v2(47.97,3.26)
  Bottom Layer w0.152: 47.97,1.83 v2(47.97,3.26)
PC8: length 20.8
  Top Layer w0.152: v2(47.47,2.91) 47.45,2.93 47.45,5.51 52.04,10.1 CN1.47
  Bottom Layer w0.152: 47.47,1.83 v2(47.47,2.91)
PC9: length 21.7
  Top Layer w0.152: v2(47,3.31) 47,5.81 51.74,10.56 62.67,10.56 CN1.45
  Bottom Layer w0.152: 46.97,1.83 47,1.86 v2(47,3.31)
PD1: length 28.8
  Top Layer w0.152: CN1.23 52.53,16.1 42.82,6.38 v2(39.45,6.38)
  Bottom Layer w0.152: U2.82 v2(39.45,6.38)
PD2: length 28.1
  Top Layer w0.152: CN1.21 52.27,16.6 42.56,6.88 v2(39.8,6.88)
  Bottom Layer w0.152: U2.83 v2(39.8,6.88)
PD3: length 28.8
  Top Layer w0.152: v2(39.45,7.38) 42.14,7.38 51.85,17.1 CN1.19
  Bottom Layer w0.152: U2.84 v2(39.45,7.38)
PD4: length 28.1
  Top Layer w0.152: CN1.17 51.48,17.6 41.77,7.88 v2(39.8,7.88)
  Bottom Layer w0.152: U2.85 v2(39.8,7.88)
PD5: length 28.8
  Top Layer w0.152: CN1.15 51.12,18.1 41.41,8.38 v2(39.45,8.38)
  Bottom Layer w0.152: U2.86 v2(39.45,8.38)
PD6: length 28.1
  Top Layer w0.152: v2(39.8,8.88) 41.09,8.88 50.8,18.6 CN1.13
  Bottom Layer w0.152: U2.87 v2(39.8,8.88)
PD7: length 28.8
  Top Layer w0.152: CN1.11 50.54,19.1 40.82,9.38 v2(39.45,9.38)
  Bottom Layer w0.152: U2.88 v2(39.45,9.38)
PD8: length 12.7
  Top Layer w0.152: CN1.67 53.88,5.1 52.47,3.69 v2(52.47,2.91)
  Bottom Layer w0.152: 52.47,1.83 v2(52.47,2.91)
PD9: length 13.5
  Top Layer w0.152: CN1.65 53.76,5.6 51.97,3.81 v2(51.97,3.26)
  Bottom Layer w0.152: 51.97,1.83 v2(51.97,3.26)
PD10: length 14.2
  Top Layer w0.152: CN1.63 53.65,6.1 51.48,3.93 v2(51.48,2.91)
  Bottom Layer w0.152: 51.47,1.83 51.48,1.84 v2(51.48,2.91)
PD11: length 15
  Top Layer w0.152: CN1.61 53.49,6.6 50.97,4.08 50.97,3.27
  Bottom Layer w0.152: 50.97,1.83 v2(50.97,3.26)
PD12: length 15.8
  Top Layer w0.152: v2(50.47,2.91) 50.47,4.24 53.33,7.1 CN1.59
  Bottom Layer w0.152: 50.47,1.83 v2(50.47,2.91)
PD13: length 16.6
  Top Layer w0.152: CN1.57 53.16,7.6 49.97,4.41 v2(49.97,3.26)
  Bottom Layer w0.152: 49.97,1.83 v2(49.97,3.26)
PD14: length 17.5
  Top Layer w0.152: v2(49.47,2.91) 49.49,2.93 49.49,4.64 52.95,8.1 CN1.55
  Bottom Layer w0.152: 49.47,1.83 v2(49.47,2.91)
PD15: length 18.3
  Top Layer w0.152: v2(48.97,3.26) 48.97,4.83 52.73,8.6 CN1.53
  Bottom Layer w0.152: 48.97,1.83 v2(48.97,3.26)
PE4: length 46.8
  Top Layer w0.152: v2(3.92,21.3) 4.92,21.3 6.6,19.62 6.81,19.62
  Inner3 w0.152: v2(3.92,21.3) 3.92,21.13 4.23,20.82 34.91,20.82 35.21,20.52 35.21,18.75 35.77,18.19 v2(43.47,18.19)
  Bottom Layer w0.152: U2.3 v2(43.47,18.19)
PE5: length 1
  Bottom Layer w0.152: U2.4 v1(43.97,17.91)
PE7: length 6.9
  Bottom Layer w0.152: U2.37 58.33,9.89 58.88,9.33 62.7,9.33 CN1.50
PE8: length 6.9
  Bottom Layer w0.152: CN1.52 58.7,8.85 58.16,9.39 U2.38
PE9: length 6.9
  Bottom Layer w0.152: U2.39 58.1,8.89 58.64,8.35 CN1.54
PE10: length 6.9
  Bottom Layer w0.152: CN1.56 62.71,7.85 58.52,7.85 57.99,8.39 U2.40
PE11: length 6.9
  Bottom Layer w0.152: U2.41 57.88,7.89 58.42,7.35 CN1.58
PE12: length 6.9
  Bottom Layer w0.152: U2.42 57.77,7.39 58.31,6.85 CN1.60
PE13: length 6.9
  Bottom Layer w0.152: U2.43 57.6,6.89 58.14,6.35 CN1.62
PE14: length 6.9
  Bottom Layer w0.152: CN1.64 58.03,5.85 57.49,6.39 U2.44
PE15: length 6.9
  Bottom Layer w0.152: CN1.66 57.97,5.35 57.43,5.89 U2.45
VCAP1: length 6.8
  Bottom Layer w0.152: U2.73 43.47,1.89 43.49,1.9 43.49,2.74 43.29,2.95 39.13,2.95
  Bottom Layer w0.305: C24.2 C23.2
VREF+: length 4.7
  Bottom Layer w0.152: R14.2 54.49,19.34 C25.2 52.47,18.91 U2.21 U2.20
$1N1959: length 1.6
  Top Layer w0.152: 6.39,2.65 7.94,2.65 LED1.2
$1N1960: length 3.8
  Top Layer w0.152: U1.3 1.06,5.8 1.22,5.64 2.8,5.64 2.95,5.79 2.95,6.65 U1.1
$1N3874: length 2.5
  Bottom Layer w0.152: U2.19 51.47,19.2 R13.2
$1N3903: length 4.7
  Bottom Layer w0.305: U2.48 57.15,4.39 57.45,4.08 57.45,2.35 57.46,2.34 ; C21.1 C22.1
$1N7049: length 4.2
  Top Layer w0.152: U4.6 15.52,3.79 X2.3 18.18,3.2 C13.2
$1N7718: length 1.7
  Top Layer w0.152: USB1.10 13.52,19.76 v2(13.52,19.76)
$1N7761: length 1.8
  Top Layer w0.152: USB1.4 v2(16.52,19.86)
$1N7868: length 6.3
  Top Layer w0.152: U4.34 14.03,13.62 14.03,12.75 13.87,12.6 9.07,12.6 TP1.1
$1N7872: length 3.1
  Top Layer w0.152: U4.37 9.62,12.12 TP2.1
$1N7979: length 4.2
  Top Layer w0.152: U4.25 18.52,14.66 18.7,14.83 21.65,14.83 R8.1
$1N8280: length 9.1
  Top Layer w0.152: U4.30 16.02,12.56 v2(16.01,12.55)
  Inner3 w0.152: v2(8.97,13.65) 8.97,12.73 9.15,12.55 v2(16.01,12.55)
$1N8284: length 1.6
  Top Layer w0.152: LED3.2 7.46,15.14 R11.2
$1N8434: length 1.7
  Top Layer w0.152: R12.2 21.63,10.12 U4.20
$1N8564: length 6.7
  Top Layer w0.152: U4.7 16.03,5.13 16.03,5.97 16.21,6.15 21.63,6.15 21.76,6.02
$1N12613: length 5.8
  Top Layer w0.152: v2(30.99,14.18) 30.98,14.16 30.98,13.52 31.24,13.25 U6.2
$1N12618: length 3.7
  Top Layer w0.152: v2(32.39,14.18) 32.62,13.95 U6.1
$1N12623: length 5.7
  Top Layer w0.152: v2(30.99,12.75) 30.99,12.12 31.26,11.85 U6.4
$1N12629: length 3.7
  Top Layer w0.152: U6.3 32.59,12.55 v2(32.39,12.75)
$1N12870: length 6.5
  Top Layer w0.152: v2(32.45,4.39) 32.49,4.43 v2(32.49,5.71) 33.07,5.71 33.38,6.02 33.38,7.5 33.53,7.65 U6.10
$1N12999: length 5.3
  Top Layer w0.152: U6.8 33.15,9.05 32.92,8.82 32.92,7.19 32.77,7.04 v2(32.45,7.04)
$1N13129: length 5
  Top Layer w0.152: U6.6 32.4,10.45 32.39,10.44 ; 32.39,10.44 v2(32.39,9.89) ; 32.39,10.44 v2(32.39,11.32)
$1N13135: length 4.5
  Top Layer w0.152: v2(32.39,8.47) 32.39,9.11 33.03,9.75 U6.7
$1N13313: length 6.6
  Top Layer w0.152: C12.1 13.88,1.46 X2.1 14.15,1.5 15.02,2.37 U4.5
$1N24000: length 11.3
  Bottom Layer w0.152: 41.75,21.3 41.76,21.31 43.62,21.31 ; 43.66,21.3 43.66,21.52 44.54,22.4 46.35,22.4 R68.2 47.97,20.77 U2.12
$1N24004: length 9.5
  Bottom Layer w0.152: 47.46,23.52 47.46,22.8 48.96,21.3 ; U2.13 48.47,20.79 R68.1 48.97,21.29 ; 45.29,23.41 47.38,23.41
$1N24569: length 6.2
  Bottom Layer w0.254: BUZZER1.2 36.78,23.69 Q1.3

## Copper pours and planes (outline as drawn; the poured copper is in the pictures)
3V3 on Top Layer: 0.92,4.98 3.61,4.98 3.61,0.25 0.92,0.25
3V3 on Bottom Layer: 55.35,23.01 63.54,23.01 63.54,18.18 55.35,18.18
3V3 on Inner2: 0.26,24.74 63.76,24.74 63.76,0.26 0.26,0.26
5V on Top Layer: 28.4,24.18 29.72,24.18 29.72,22.91 28.4,22.91
5V on Bottom Layer: 56.53,23.91 63.53,23.91 63.53,19.18 56.53,19.18
5V on Inner2: 2.53,18.95 17.95,18.95 17.95,12.79 2.53,12.79
5V on Inner3: 28.4,24.18 29.72,24.18 29.72,22.91 28.4,22.91
GND on Bottom Layer: 58.24,4.01 63.53,4.01 63.53,0.45 58.24,0.45
GND on Bottom Layer: 58.26,24.49 63.54,24.49 63.54,20.18 58.26,20.18
GND on Inner1: 0.26,24.74 63.76,24.74 63.76,0.26 0.26,0.26
GND on Inner4: 0.26,24.74 63.76,24.74 63.76,0.26 0.26,0.26
$1N1960 on Top Layer: 2.49,11.38 4.27,11.38 4.27,5.99 2.49,5.99

Small or netless copper shapes (teardrops, artwork), in the pictures only: 194 on Top Layer, 268 on Bottom Layer, 16 on Inner1, 26 on Inner3, 16 on Inner4

## Text on the board
Top Silkscreen Layer: Hello_World
